# Altium project 13_PCB_Project_13.PrjPcb
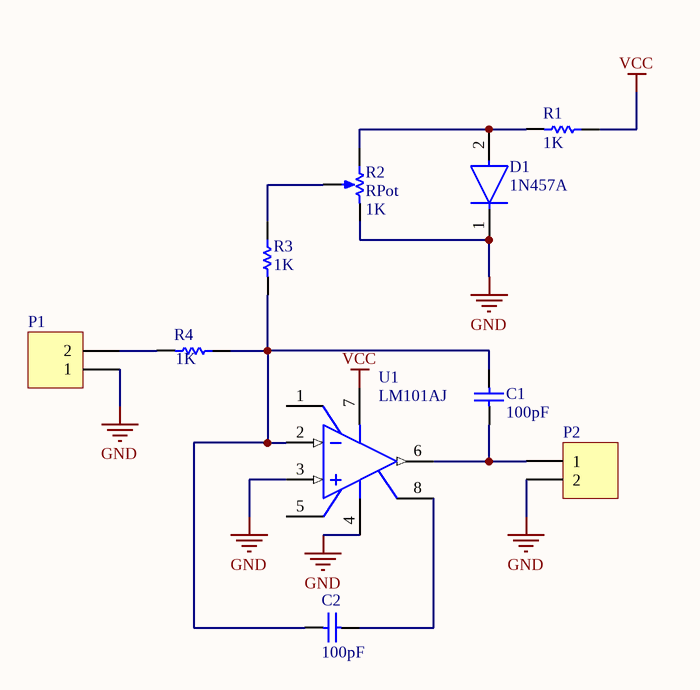
[diagram p0: Sheet1.SchDoc]
1 sheet, 10 parts. Net scope: global (net labels, ports and power ports of the same name join across sheets).
Board file: PCB1.PcbDoc

## Sheet Sheet1.SchDoc
size A; SheetNumber: 1; SheetTotal: 1

### Parts
C1  value 100pF  [RAD-0.3]  (hidden comment: Cap)
C2  value 100pF  [RAD-0.3]  (hidden comment: Cap)
D1  1N457A  [FP-017AG-MFG]
P1  Header 2  [HDR1X2]  (value not drawn)
P2  Header 2  [HDR1X2]  (value not drawn)
R1  value 1K  [AXIAL-0.3]  (hidden comment: Res1)
R2  RPot  value 1K  [VR5]
R3  value 1K  [AXIAL-0.3]  (hidden comment: Res1)
R4  value 1K  [AXIAL-0.3]  (hidden comment: Res1)
U1  LM101AJ  [NAB0008A]

### Nets
GND: D1.1(C) P1.1 P2.2 R2.2(BOT) U1.3(IN+) U1.4(V-)
VCC: R1.1 U1.7(V+)
NetC1_1: C1.1 P2.1 U1.6(OUT)
NetC1_2: C1.2 C2.1 R3.2 R4.1 U1.2(IN-)
NetC2_2: C2.2 U1.8(COMP)
NetD1_2: D1.2(A) R1.2 R2.1(TOP)
NetP1_2: P1.2 R4.2
NetR2_3: R2.3(TAP) R3.1

Not connected (* = marked no-connect by the designer): U1 1(BAL/COMP) 5(BAL)

### Library data of the parts
C1 C2 = Cap: Capacitor; Published: 8-Jun-2000; LatestRevisionDate: 17-Jul-2002; LatestRevisionNote: Re-released for DXP Platform.; PackageReference: RAD-0.3; Publisher: Altium Limited; PackageDescription: Radial Cap, Thru-Hole; 2 Leads; 0.3 in Pin Spacing
D1 = CMP-00278-84323142-1: 1N457A Diode Standard Recovery Rectifier 70 Volt 0.2A 2-Pin DO-35 Bulk; Manufacturer Lifecycle Status: ACTIVE; Max Reverse Voltage (DC): 70V; Power Dissipation: 500mW; Forward Current: 200mA; Element Configuration: Single; Peak Non-Repetitive Surge Current: 4A; Max Forward Surge Current (Ifsm): 1A; Capacitance: 8pF; Peak Reverse Current: 25nA; Max Junction Temperature (Tj): 175°C; Current: 2A; Forward Voltage: 1V; Case/Package: Axial; Height: 1.91mm; Lead Free: Lead Free; Min Operating Temperature: -65°C; Length: 4.06mm; Weight: 4.535924g; Output Current: 200mA; REACH SVHC: No SVHC; Packaging: Bulk; Voltage Rating (DC): 70V; Width: 1.91mm; Lifecycle Status: Production; Contact Plating: Tin; Polarity: Standard; Number of Pins: 2; Max Surge Current: 4A; Max Operating Temperature: 175°C; Schedule B: 8541100070, 8541100070|8541100070, 8541100070|8541100070|8541100070, 8541100070|8541100070|8541100070|8541100070; Max Repetitive Reverse Voltage (Vrrm): 70V; Mount: Through Hole; NexarPartId: 84323142; Voltage: 70V; Radiation Hardening: No; RoHS: Compliant; Current Rating: 200mA; Reverse Voltage: 70V; Average Rectified Current: 200mA; Termination: Axial
P1 P2 = Header 2: Header, 2-Pin; LatestRevisionDate: 17-Jul-2002; LatestRevisionNote: Re-released for DXP Platform.; Publisher: Altium Limited
R1 R3 R4 = Res1: Resistor; Published: 8-Jun-2000; LatestRevisionDate: 17-Jul-2002; LatestRevisionNote: Re-released for DXP Platform.; PackageReference: AXIAL-0.3; Publisher: Altium Limited; PackageDescription: Axial Device, Thru-Hole; 2 Leads; 0.3 in Pin Spacing
R2 = RPot: Potentiometer; Sim Note: Enter the Resistance value and the set point into parameter fields.; Set Position: 0.5; Published: 8-Jun-2000; LatestRevisionDate: 17-Jul-2002; LatestRevisionNote: Re-released for DXP Platform.; PackageReference: VR5; Publisher: Altium Limited; PackageDescription: Variable Resistor, Thru-Hole; 3 Leads
U1 = CMP-0055-00190-3: Operational Amplifier, 8-pin CerDIP; Manufacturer: Texas Instruments; PowerWise: N; CompType: Amplifiers; PackageTopMarking: NSUZXYTT*LM101AJ; ComponentLink1URL: http://www.ti.com/general/docs/lit/getliterature.tsp?genericPartNumber=LM101A-N&fileType=pdf; RoHS: N; ComponentLink1Description: Datasheet URL; PackageDescription: Cerdip, .400 x .310in Body, 8 Lead, .300in Centers, .100in Pitch; Package Reference: NAB0008A; PinCount: 8